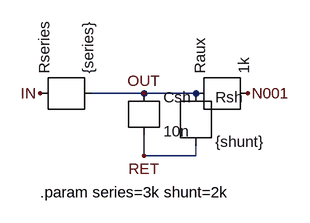
[diagram p0: schematic leaf.asc]
leaf.asc, the LTspice schematic file:
Version 4
SHEET 1 880 680
FLAG 0 80 IN
FLAG 160 80 OUT
FLAG 160 176 RET
FLAG 320 80 N001
WIRE 160 80 80 80
WIRE 240 80 160 80
WIRE 160 176 160 144
WIRE 240 176 160 176
WIRE 240 176 240 160
SYMBOL res -16 96 R270
SYMATTR InstName Rseries
SYMATTR Value {series}
SYMBOL cap 144 80 R0
SYMATTR InstName Csh
SYMATTR Value 10n
SYMBOL res 224 64 R0
SYMATTR InstName Rsh
SYMATTR Value {shunt}
SYMBOL res 224 96 R270
SYMATTR InstName Raux
SYMATTR Value 1k
TEXT 0 232 Left 2 !.param series=3k shunt=2k

The netlist it stands for:
* leaf.asc
XRseries IN OUT {series}
XCsh OUT RET 10n
XRsh OUT RET {shunt}
XRaux OUT N001 1k
.param series=3k shunt=2k
.backanno
.end